# Altium schematic sheet PreDriver.SchDoc
size A4
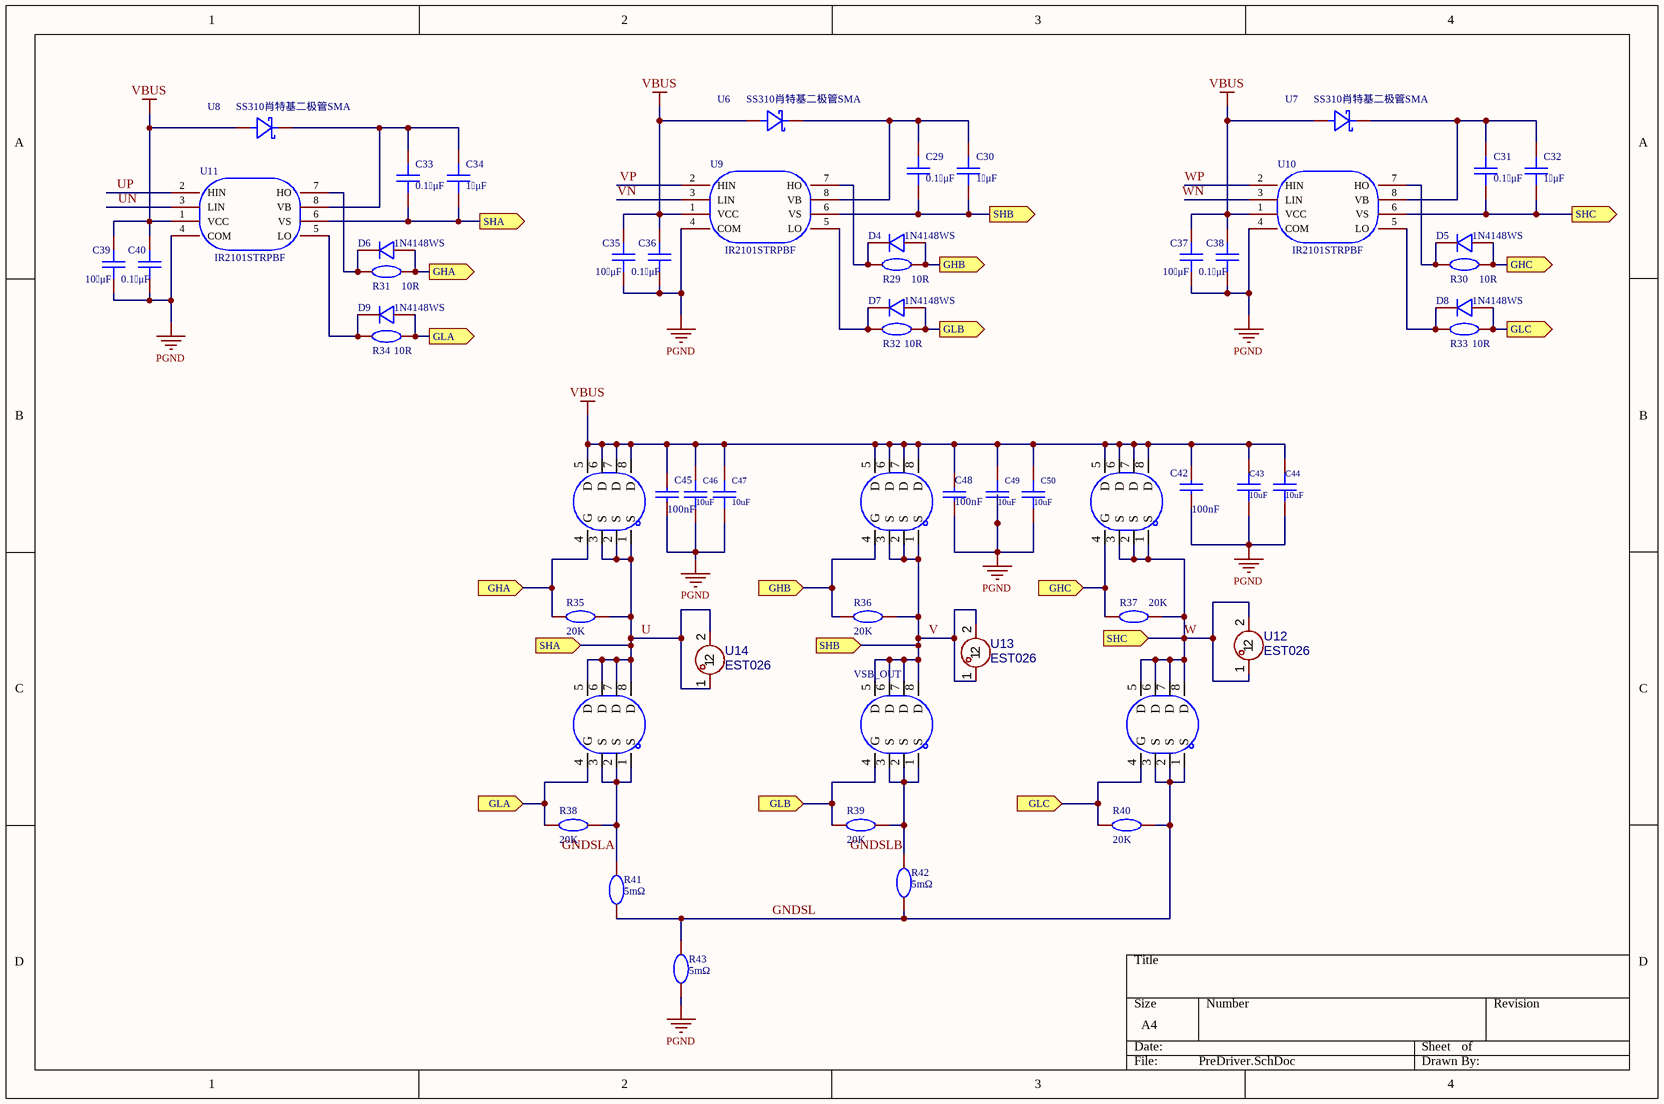
[diagram p0: PreDriver.SchDoc]

## Parts
C29  0.1 μF  [C0603]
C30  1 μF  [C0603]
C31  0.1 μF  [C0603]
C32  1 μF  [C0603]
C33  0.1 μF  [C0603]
C34  1 μF  [C0603]
C35  10 μF  [C0603]
C36  0.1 μF  [C0603]
C37  10 μF  [C0603]
C38  0.1 μF  [C0603]
C39  10 μF  [C0603]
C40  0.1 μF  [C0603]
C42  100nF  [C1206]
C43  10uF  [C1206]
C44  10uF  [C1206]
C45  100nF  [C1206]
C46  10uF  [C1206]
C47  10uF  [C1206]
C48  100nF  [C1206]
C49  10uF  [C1206]
C50  10uF  [C1206]
D4  1N4148WS  [SOD-323_L1.8-W1.3-LS2.5-RD]
D5  1N4148WS  [SOD-323_L1.8-W1.3-LS2.5-RD]
D6  1N4148WS  [SOD-323_L1.8-W1.3-LS2.5-RD]
D7  1N4148WS  [SOD-323_L1.8-W1.3-LS2.5-RD]
D8  1N4148WS  [SOD-323_L1.8-W1.3-LS2.5-RD]
D9  1N4148WS  [SOD-323_L1.8-W1.3-LS2.5-RD]
Q4  ne006ng  [DFN5X6-8_L5.8-W5.0-P1.27-LS6.2-BL-EP]  (value not drawn)
Q5  ne006ng  [DFN5X6-8_L5.8-W5.0-P1.27-LS6.2-BL-EP]  (value not drawn)
Q6  ne006ng  [DFN5X6-8_L5.8-W5.0-P1.27-LS6.2-BL-EP]  (value not drawn)
Q7  ne006ng  [DFN5X6-8_L5.8-W5.0-P1.27-LS6.2-BL-EP]  (value not drawn)
Q8  ne006ng  [DFN5X6-8_L5.8-W5.0-P1.27-LS6.2-BL-EP]  (value not drawn)
Q9  ne006ng  [DFN5X6-8_L5.8-W5.0-P1.27-LS6.2-BL-EP]  (value not drawn)
R29  10R  [R0603]
R30  10R  [R0603]
R31  10R  [R0603]
R32  10R  [R0603]
R33  10R  [R0603]
R34  10R  [R0603]
R35  20K  [R0603]
R36  20K  [R0603]
R37  20K  [R0603]
R38  20K  [R0603]
R39  20K  [R0603]
R40  20K  [R0603]
R41  5mΩ  [R0612]
R42  5mΩ  [R0612]
R43  5mΩ  [R0612]
U6  SS310肖特基二极管SMA  [SMA_L4.3-W2.6-LS5.1-R-RD]
U7  SS310肖特基二极管SMA  [SMA_L4.3-W2.6-LS5.1-R-RD]
U8  SS310肖特基二极管SMA  [SMA_L4.3-W2.6-LS5.1-R-RD]
U9  IR2101STRPBF  [SOIC-8_L5.0-W4.0-P1.27-LS6.0-BL]
U10  IR2101STRPBF  [SOIC-8_L5.0-W4.0-P1.27-LS6.0-BL]
U11  IR2101STRPBF  [SOIC-8_L5.0-W4.0-P1.27-LS6.0-BL]
U12  EST026  [CONN-TH_L6.3-W0.8-EST026]
U13  EST026  [CONN-TH_L6.3-W0.8-EST026]
U14  EST026  [CONN-TH_L6.3-W0.8-EST026]

## Ports
GHA (in), GHA (out), GHB (in), GHB (out), GHC (in), GHC (out), GLA (in), GLA (out), GLB (in), GLB (out), GLC (in), GLC (out), SHA (in), SHA (out), SHB (in), SHB (out), SHC (in), SHC (out)

## Nets
PGND: C35.1 C36.1 C37.1 C38.1 C39.1 C40.1 C42.1 C43.1 C44.1 C45.1 C46.1 C47.1 C48.1 C49.1 C50.1 R43.1 U9.4(COM) U10.4(COM) U11.4(COM)
VBUS: C35.2 C36.2 C37.2 C38.2 C39.2 C40.2 C42.2 C43.2 C44.2 C45.2 C46.2 C47.2 C48.2 C49.2 C50.2 Q4.5(D) Q4.6(D) Q4.7(D) Q4.8(D) Q5.5(D) Q5.6(D) Q5.7(D) Q5.8(D) Q6.5(D) Q6.6(D) Q6.7(D) Q6.8(D) U6.1(A) U7.1(A) U8.1(A) U9.1(VCC) U10.1(VCC) U11.1(VCC)
GHA: D6.2(A) Q4.4(G) R31.1 R35.2 ; port GHA
GHB: D4.2(A) Q5.4(G) R29.1 R36.2 ; port GHB
GHC: D5.2(A) Q6.4(G) R30.1 R37.2 ; port GHC
GLA: D9.2(A) Q7.4(G) R34.1 R38.2 ; port GLA
GLB: D7.2(A) Q8.4(G) R32.1 R39.2 ; port GLB
GLC: D8.2(A) Q9.4(G) R33.1 R40.2 ; port GLC
GNDSL: Q9.1(S) Q9.2(S) Q9.3(S) R40.1 R41.1 R42.1 R43.2
GNDSLA: Q7.1(S) Q7.2(S) Q7.3(S) R38.1 R41.2
GNDSLB: Q8.1(S) Q8.2(S) Q8.3(S) R39.1 R42.2
U: C33.1 C34.1 Q4.1(S) Q4.2(S) Q4.3(S) Q7.5(D) Q7.6(D) Q7.7(D) Q7.8(D) R35.1 U11.6(VS) U14.1 U14.2 ; port SHA
UN: U11.3(LIN)
UP: U11.2(HIN)
V: C29.1 C30.1 Q5.1(S) Q5.2(S) Q5.3(S) Q8.5(D) Q8.6(D) Q8.7(D) Q8.8(D) R36.1 U9.6(VS) U13.1 U13.2 ; port SHB
VN: U9.3(LIN)
VP: U9.2(HIN)
W: C31.1 C32.1 Q6.1(S) Q6.2(S) Q6.3(S) Q9.5(D) Q9.6(D) Q9.7(D) Q9.8(D) R37.1 U10.6(VS) U12.1 U12.2 ; port SHC
WN: U10.3(LIN)
WP: U10.2(HIN)
NetC29_2: C29.2 C30.2 U6.2(K) U9.8(VB)
NetC31_2: C31.2 C32.2 U7.2(K) U10.8(VB)
NetC33_2: C33.2 C34.2 U8.2(K) U11.8(VB)
NetD4_1: D4.1(K) R29.2 U9.7(HO)
NetD5_1: D5.1(K) R30.2 U10.7(HO)
NetD6_1: D6.1(K) R31.2 U11.7(HO)
NetD7_1: D7.1(K) R32.2 U9.5(LO)
NetD8_1: D8.1(K) R33.2 U10.5(LO)
NetD9_1: D9.1(K) R34.2 U11.5(LO)

## Notes on the sheet
- Labels drawn without touching a wire or pin: VSB_OUT

## Library data of the parts
C29-C40 = CAP_0603: Symbol: Capacitance; 3D Model: ac125912035d415993ca9572d50418b1聨0819f05c4eef4c71ace90d822a990e87; 3D Model Transform: 62.992,31.496,0,0,0,0,0,0,0; ConvertToPcb: yes; ModelName: C0603_L1.6-W0.8-H0.8; Device: CAP_0603; Supplier Footprint: 0603; AddInBom: yes; FootprintName: C0603
  C29 C31 C33 C36 C38 C40: Value: 0.1 μF
  C30 C32 C34: Value: 1 μF
  C35 C37 C39: Value: 10 μF
C42 C45 C48 = CL31B104KBCNNNC: 容值:100nF;精度:±10%;额定电压:50V;温度系数:X7R;; Manufacturer: SAMSUNG(三星); AddInBom: yes; ModelId: e4be705b945545a48e666415e3682bd8聨0819f05c4eef4c71ace90d822a990e87; ModelName: C1206_L3.2-W1.6-H1.3; ModelTransform: 125.984,62.992,0,0,0,0,0,0,0; Tolerance: ±10%; Voltage Rating: 50V; Temperature Coefficient: X7R; Symbol: CL31B104KBCNNNC; Device: CL31B104KBCNNNC; LCSC Part Name: 100nF ±10% 50V; SupplierPart: C24497; ManufacturerPart: CL31B104KBCNNNC; Supplier Footprint: 1206; JLCPCB Part Class: Basic Part; Datasheet: https://item.szlcsc.com/datasheet/CL31B104KBCNNNC/25237.html; Supplier: LCSC; ConvertToPcb: yes; FootprintName: C1206; Value: 100nF
C43 C44 C46 C47 C49 C50 = HGC1206R5106M500NSPJ: 容值:10uF;精度:±20%;额定电压:50V;温度系数:X5R;; Manufacturer: Chinocera(华瓷); AddInBom: yes; ModelId: e4be705b945545a48e666415e3682bd8聨0819f05c4eef4c71ace90d822a990e87; ModelName: C1206_L3.2-W1.6-H1.3; ModelTransform: 125.984,62.992,0,0,0,0,0,0,0; Tolerance: ±20%; Voltage Rating: 50V; Temperature Coefficient: X5R; Symbol: HGC1206R5106M500NSPJ; Device: HGC1206R5106M500NSPJ; LCSC Part Name: 10uF ±20% 50V; SupplierPart: C7432782; ManufacturerPart: HGC1206R5106M500NSPJ; Supplier Footprint: 1206; JLCPCB Part Class: Extended Part; Datasheet: https://item.szlcsc.com/datasheet/HGC1206R5106M500NSPJ/8438264.html; Supplier: LCSC; ConvertToPcb: yes; FootprintName: C1206; Value: 10uF
D4-D9 = 1N4148WS_C2128: 二极管配置:独立式;整流电流:150mA;直流反向耐压(Vr):100V;正向压降(Vf):1.25V@150mA;反向恢复时间(Trr):4ns;; Manufacturer: CJ(江苏长电/长晶); Symbol: 1N4148WS T4; 3D Model: db63db13d9e342eb939127d413d6200b聨0819f05c4eef4c71ace90d822a990e87; 3D Model Transform: 104.3305,51.181,0,0,0,0,0,-0.004,0; Diode Configuration: 独立式; Pd - Power Dissipation: 200mW; Current - Rectified: 150mA; Voltage - DC Reverse(Vr): 100V; Non-Repetitive Peak Forward Surge Current: 2A; Reverse Leakage Current (Ir): 1uA@75V; Reverse Recovery Time (trr): 4ns; AddInBom: yes; Device: 1N4148WS_C2128; LCSC Part Name: 丝印T4 100V 150mA; Supplier Part: C2128; Manufacturer Part: 1N4148WS; Supplier Footprint: SOD-323; JLCPCB Part Class: Basic Part; Datasheet: https://item.szlcsc.com/datasheet/1N4148WS/2485.html; Supplier: LCSC; Voltage - Forward(Vf@If): 1.25V@150mA; Operating Junction Temperature Range: -; ConvertToPcb: yes; FootprintName: SOD-323_L1.8-W1.3-LS2.5-RD; ModelName: SOD-323_L1.8-W1.3-LS2.5-RD
Q4-Q9 = ne006ng: 数量:1个N沟道;漏源电压(Vdss):60V;连续漏极电流(Id):70A;导通电阻(RDS(on)):4.6mΩ@10V;耗散功率(Pd):84W;阈值电压(Vgs(th)):2.7V;; Manufacturer: DOINGTER(杜因特); AddInBom: yes; ModelId: 82d86f10988147ef9b82700d9bd42f65; ModelTransform: 200.787,239.17275,0,0,0,0,0.002,-0.004,0; Number: 1个N沟道; Drain to Source Voltage: 60V; Current - Continuous Drain(Id): 70A; Pd - Power Dissipation: 84W; Gate Threshold Voltage (Vgs(th)): 2.7V; Gate Charge(Qg): 90nC@10V; Input Capacitance(Ciss): 4nF; Reverse Transfer Capacitance (Crss@Vds): 252pF; Type: N沟道; Output Capacitance(Coss): 309pF; LCSC Part Name: N沟道MOSFET采用先进沟槽技术，具备低栅极电荷和出色散热性能; SupplierPart: C54157801; ManufacturerPart: NE006NG; Supplier Footprint: DFN-8(5x6); JLCPCB Part Class: Extended Part; Datasheet: https://item.szlcsc.com/datasheet/NE006NG/57396370.html; Supplier: LCSC; ConvertToPcb: yes; SymbolName: NE006NG; FootprintName: DFN5X6-8_L5.8-W5.0-P1.27-LS6.2-BL-EP; ModelName: DFN5X6-8_L5.8-W5.0-P1.27-LS6.2-BL-EP; RDS(on): 4.6mΩ@10V; Operating Temperature: -50℃~+150℃
R29-R40 = Res_0603: Symbol: 电阻; 3D Model: fc143cca1e79419f9cd78b61e9279f08聨0819f05c4eef4c71ace90d822a990e87; 3D Model Transform: 31.8897,63.7794,0,90,0,0,0,0,0; ConvertToPcb: yes; Device: Res_0603; Supplier Footprint: 0603; AddInBom: yes; FootprintName: R0603; ModelName: R0603
  R29-R34: Value: 10R
  R35-R40: Value: 20K
R41-R43 = MLR06A1R005F2: 电阻类型:合金电阻;阻值:5mΩ;精度:±1%;功率:1W;温度系数:±50ppm/℃;安装方式:贴片;; Manufacturer: prosemi(普罗森美); AddInBom: yes; ModelId: f1de2025d8034c8f979ea2bb0fb44f5c聨0819f05c4eef4c71ace90d822a990e87; ModelTransform: 62.992,125.984,0,0,0,0,0,0,0; Tolerance: ±1%; Power(Watts): 1W; Symbol: MLR06A1R005F2; Device: MLR06A1R005F2; LCSC Part Name: 5mΩ ±1% 1W; SupplierPart: C21261109; ManufacturerPart: MLR06A1R005F2; Supplier Footprint: 0612; JLCPCB Part Class: Extended Part; Datasheet: https://item.szlcsc.com/datasheet/MLR06A1R005F2/22679766.html; Supplier: LCSC; ConvertToPcb: yes; FootprintName: R0612; ModelName: R0612; Type: 合金电阻; Value: 5mΩ; Temperature Coefficient: ±50ppm/℃; Mounting Type: 贴片
U6-U8 = SS310肖特基二极管SMA: 3D Model: 6890bb9641474820a71fce2135ca3aaa聨0819f05c4eef4c71ace90d822a990e87; 3D Model Transform: 194.8815,98.425,0,0,0,0,0,0,0; AddInBom: yes; Symbol: SS310肖特基二极管SMA; Device: SS310肖特基二极管SMA; LCSC Part Name: SS310肖特基二极管SMA; Supplier Part: C9900014981; Manufacturer Part: SS310肖特基二极管SMA; Supplier Footprint: SS310SMA110V; JLCPCB Part Class: Extended Part; Supplier: LCSC; ConvertToPcb: yes; FootprintName: SMA_L4.3-W2.6-LS5.1-R-RD; ModelName: SMA_L4.3-W2.6-LS5.1-R-RD
U9-U11 = IR2101STRPBF: 驱动配置:半桥;负载类型:IGBT；MOSFET;驱动通道数:2;灌电流(IOL):270mA;拉电流(IOH):130mA;工作电压:10V~20V;上升时间(tr):100ns;下降时间(tf):50ns;; Manufacturer: Infineon(英飞凌); 3D Model: 7abc64c95a1a4a04a4ef38f9097c870b聨0819f05c4eef4c71ace90d822a990e87; 3D Model Transform: 192.913,236.22,0,0,0,0,0,0,0; Driven Configuration: 半桥; Number of Drivers: 2; Current - Output Low(IOL): 270mA; Current - Output High(IOH): 130mA; Rise Time: 100ns; Fall Time: 50ns; Propagation Delay tpLH: 160ns; Propagation Delay tpHL: 150ns; Quiescent Current(Iq): 150uA; AddInBom: yes; Symbol: IR2101STRPBF; Device: IR2101STRPBF; LCSC Part Name: 高低侧驱动器; Supplier Part: C2956; Manufacturer Part: IR2101STRPBF; Supplier Footprint: SOIC-8; JLCPCB Part Class: Extended Part; Datasheet: https://item.szlcsc.com/datasheet/IR2101STRPBF/3338.html; Supplier: LCSC; Load Type: IGBT；MOSFET; Voltage - Supply: 10V~20V; Features: 交错导通保护; Operating Temperature: -40℃~+150℃; Input Logic Level - High: -; Input Logic Level - Low: -; ConvertToPcb: yes; FootprintName: SOIC-8_L5.0-W4.0-P1.27-LS6.0-BL; ModelName: SOIC-8_L5.0-W4.0-P1.27-LS6.0-BL
U12-U14 = EST026: 环保; Manufacturer: xcfuse(旭程); AddInBom: yes; ModelId: caeb915258b34f389ee2048176497ca2; ModelTransform: 328.7395,78.74,0,0,0,0,0,0,-137.795; Symbol: EST026; Device: EST026; LCSC Part Name: EST026; SupplierPart: C52878; ManufacturerPart: EST026; Supplier Footprint: 插件; JLCPCB Part Class: 扩展库; Datasheet: https://item.szlcsc.com/datasheet/EST026/53893.html; Supplier: LCSC; ConvertToPcb: yes; FootprintName: CONN-TH_L6.3-W0.8-EST026; ModelName: CONN-TH_L6.3-W0.8-EST026